# Altium schematic sheet Sheet1.SchDoc (part 2 of 3)
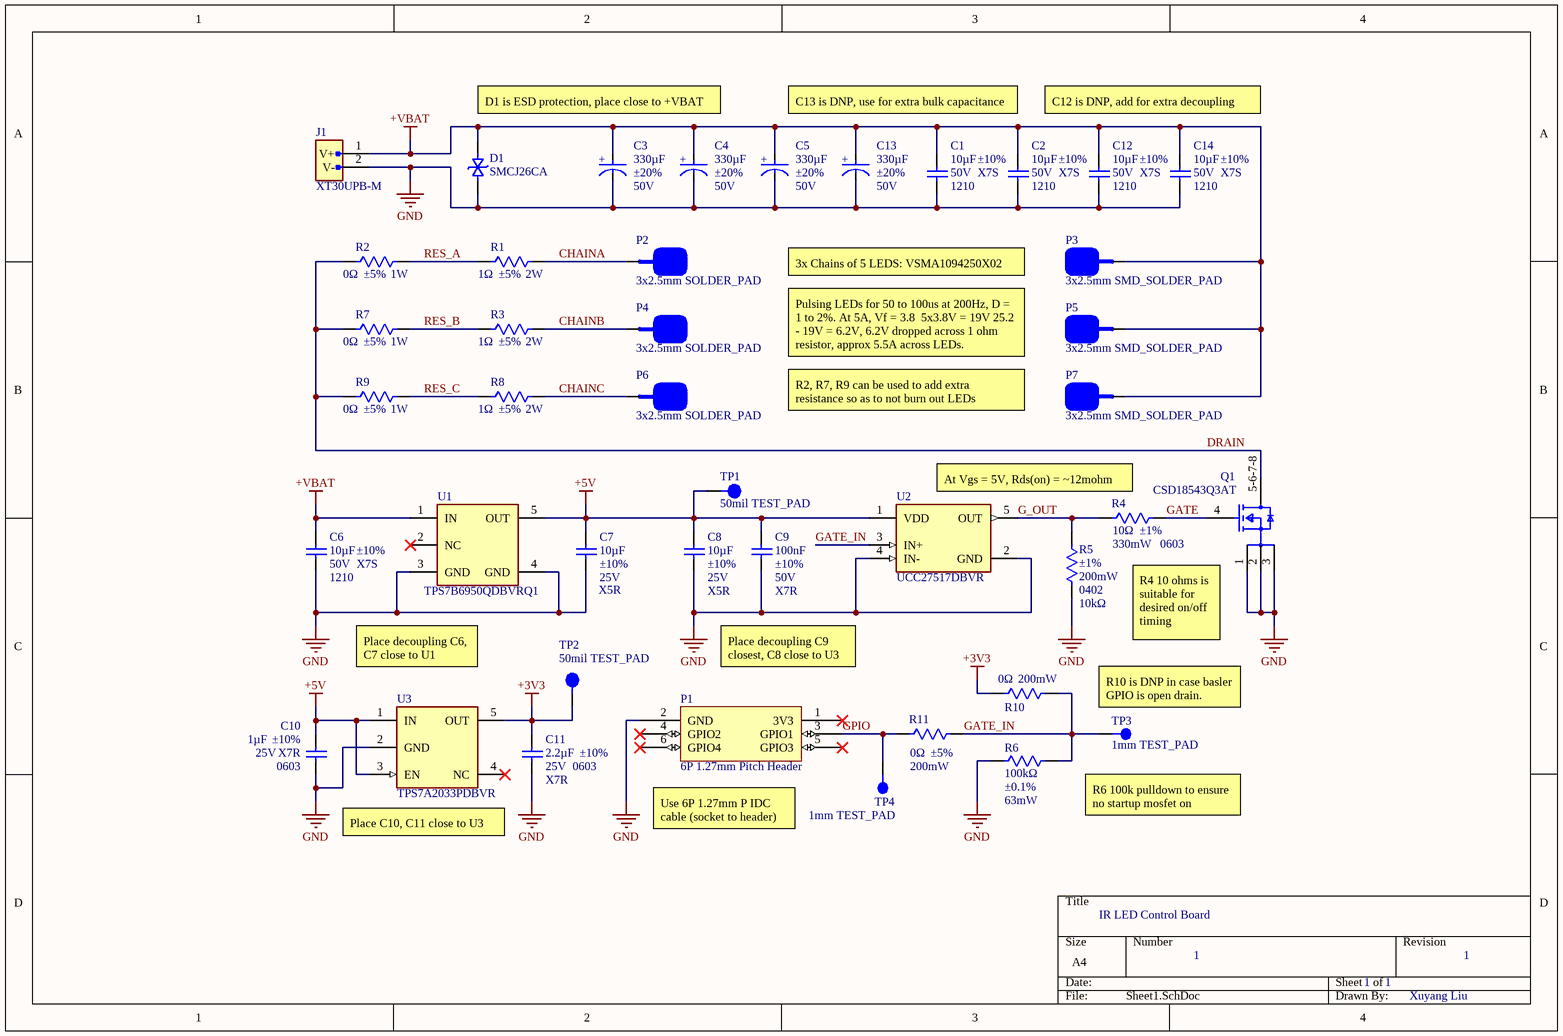
[diagram p1: Sheet1.SchDoc]
## Library data of the parts
C1 C2 C6 C12 C14 = GCM32EC71H106KA03L: 50V 10uF X7S ±10% 1210 Multilayer Ceramic Capacitors MLCC - SMD/SMT ROHS; Manufacturer: Murata; Manufacturer Lifecycle Status: IN PRODUCTION; Manufacturer Package Identifier: 1210 (3225 Metric); Supplier 1: DigiKey; Manufacturer Part Number: GCM32EC71H106KA03L; RoHS: Compliant; Category: Ceramic Capacitors; Stock 1: 65390; Pricing 1: 1=0.9, 10=0.569, 50=0.4396, 100=0.3997, 500=0.33218 (USD); Case Code (Imperial): 1210; Case Code (Metric): 3225; Country of Origin: Japan, Philippines; Depth: 2.5mm; Dielectric Material: Ceramic; Export Control Classification Number (ECCN) Code: EAR99; Height: 2.5mm; Harmonized Tariff Schedule (HTS) Code: 8532.24.00.20; Introduction Date: 2013-11-20; Length: 3.2mm; Lifecycle Status: Production; Material: Ceramic; Max Operating Temperature: 125°C; Min Operating Temperature: -55°C; Mount: Surface Mount; Number of Terminals: 2; Ratings: AEC-Q200; REACH SVHC: Yes; Schedule B: 8532240020, 8532240020|8532240020, 8532240020|8532240020|8532240020, 8532240020|8532240020|8532240020|8532240020; Termination: SMD/SMT; Voltage Rating (DC): 50V; Weight: 109.99615mg; Width: 2.5mm; ComponentLink1URL: https://datasheet.octopart.com:443/GCM32EC71H106KA03L-Murata-datasheet-96711494.pdf?src-supplier=element14+APAC; ComponentLink1Description: https://datasheet.octopart.com:443/GCM32EC71H106KA03L-Murata-datasheet-96711494.pdf?src-supplier=element14+APAC; ComponentLink2URL: https://datasheet.octopart.com:443/GCM32EC71H106KA03L-Murata-datasheet-141269272.pdf?src-supplier=Ciiva; ComponentLink2Description: https://datasheet.octopart.com:443/GCM32EC71H106KA03L-Murata-datasheet-141269272.pdf?src-supplier=Ciiva; ComponentLink3URL: https://datasheet.octopart.com:443/GCM32EC71H106KA03L-Murata-datasheet-140661459.pdf?src-supplier=Ciiva; ComponentLink3Description: https://datasheet.octopart.com:443/GCM32EC71H106KA03L-Murata-datasheet-140661459.pdf?src-supplier=Ciiva; ComponentLink4URL: https://datasheet.octopart.com:443/GCM32EC71H106KA03L-Murata-datasheet-138720471.pdf?src-supplier=Ciiva; ComponentLink4Description: https://datasheet.octopart.com:443/GCM32EC71H106KA03L-Murata-datasheet-138720471.pdf?src-supplier=Ciiva; ComponentLink5URL: https://datasheet.octopart.com:443/GCM32EC71H106KA03L-Murata-datasheet-12511495.pdf?src-supplier=TME; ComponentLink5Description: https://datasheet.octopart.com:443/GCM32EC71H106KA03L-Murata-datasheet-12511495.pdf?src-supplier=TME; ComponentLink6URL: http://sigma.octopart.com:80/reach_statement/Murata-company-16.pdf?src-supplier=Compliance+Statements; ComponentLink6Description: http://sigma.octopart.com:80/reach_statement/Murata-company-16.pdf?src-supplier=Compliance+Statements; Supplier Part Number 1: 490-14536-1-ND
C3-C5 C13 = 50ZLJ330M10X16: 330uF 50V ±20% Plugin, D10xL16mm Aluminum Electrolytic Capacitors - Leaded ROHS; Manufacturer: Rubycon; Leakage Current: 165µA; Ripple Current: 1.155A; Supplier 1: DigiKey; Manufacturer Part Number: 50ZLJ330M10X16; RoHS: Compliant; Category: Aluminum Electrolytic Capacitors; Stock 1: 990; Pricing 1: 1=0.92, 10=0.578, 50=0.4358, 100=0.3908, 500=0.31312, 1000=0.28861, 3000=0.25797, 5000=0.24651 (USD); Case/Package: Radial; Diameter: 10mm; Length: 16mm; Lifecycle Status: Production; Max Operating Temperature: 105°C; Min Operating Temperature: -40°C; Mount: Through Hole; Number of Terminals: 2; Packaging: Bulk; REACH SVHC: Yes; Terminal Pitch: 5mm; ComponentLink1URL: https://datasheet.octopart.com:443/50ZLJ330M10X16-Rubycon-datasheet-182101256.pdf?src-supplier=IHS; ComponentLink1Description: https://datasheet.octopart.com:443/50ZLJ330M10X16-Rubycon-datasheet-182101256.pdf?src-supplier=IHS; Supplier Part Number 1: 1189-50ZLJ330M10X16-ND
C7 C8 = GRM188R61E106KA73J: 25V 10uF X7R ±10% 0603 Multilayer Ceramic Capacitors MLCC - SMD/SMT ROHS; Manufacturer: Murata; Manufacturer Lifecycle Status: IN PRODUCTION; Supplier 1: DigiKey; Manufacturer Part Number: GRM188R61E106KA73J; RoHS: Compliant; Category: Ceramic Capacitors; Stock 1: 170211; Pricing 1: 1=0.26, 10=0.149, 50=0.1072, 100=0.0945, 500=0.07304, 1000=0.06643, 2500=0.05947, 5000=0.05528 (USD); Dielectric Material: Ceramic; Height: 800µm; Length: 1.6mm; Lifecycle Status: Production; Material: Ceramic; Max Operating Temperature: 85°C; Min Operating Temperature: -55°C; Mount: Surface Mount; Number of Terminals: 2; REACH SVHC: Yes; Thickness: 800µm; Voltage Rating (DC): 25V; Width: 800µm; ComponentLink1URL: https://datasheet.octopart.com:443/GRM188R61E106KA73J-Murata-datasheet-165579666.pdf?src-supplier=TME; ComponentLink1Description: https://datasheet.octopart.com:443/GRM188R61E106KA73J-Murata-datasheet-165579666.pdf?src-supplier=TME; ComponentLink2URL: https://datasheet.octopart.com:443/GRM188R61E106KA73J-Murata-datasheet-141274968.pdf?src-supplier=Ciiva; ComponentLink2Description: https://datasheet.octopart.com:443/GRM188R61E106KA73J-Murata-datasheet-141274968.pdf?src-supplier=Ciiva; ComponentLink3URL: https://datasheet.octopart.com:443/GRM188R61E106KA73J-Murata-datasheet-140704821.pdf?src-supplier=Ciiva; ComponentLink3Description: https://datasheet.octopart.com:443/GRM188R61E106KA73J-Murata-datasheet-140704821.pdf?src-supplier=Ciiva; ComponentLink4URL: https://datasheet.octopart.com:443/GRM188R61E106KA73J-Murata-datasheet-138742889.pdf?src-supplier=Ciiva; ComponentLink4Description: https://datasheet.octopart.com:443/GRM188R61E106KA73J-Murata-datasheet-138742889.pdf?src-supplier=Ciiva; ComponentLink5URL: https://datasheet.octopart.com/GRM188R61E106KA73J-Murata-datasheet-12515295.pdf; ComponentLink5Description: https://datasheet.octopart.com/GRM188R61E106KA73J-Murata-datasheet-12515295.pdf; ComponentLink6URL: https://datasheet.octopart.com/GRM188R61E106KA73J-Murata-datasheet-12510076.pdf; ComponentLink6Description: https://datasheet.octopart.com/GRM188R61E106KA73J-Murata-datasheet-12510076.pdf; ComponentLink7URL: https://datasheet.octopart.com/GRM188R61E106KA73J-Murata-datasheet-11978611.pdf; ComponentLink7Description: https://datasheet.octopart.com/GRM188R61E106KA73J-Murata-datasheet-11978611.pdf; ComponentLink8URL: https://datasheet.octopart.com/GRM188R61E106KA73J-Murata-datasheet-10025737.pdf; ComponentLink8Description: https://datasheet.octopart.com/GRM188R61E106KA73J-Murata-datasheet-10025737.pdf; ComponentLink9URL: https://datasheet.octopart.com/GRM188R61E106KA73J-Murata-datasheet-8819587.pdf; ComponentLink9Description: https://datasheet.octopart.com/GRM188R61E106KA73J-Murata-datasheet-8819587.pdf; ComponentLink10URL: http://sigma.octopart.com:80/reach_statement/Murata-company-16.pdf?src-supplier=Compliance+Statements; ComponentLink10Description: http://sigma.octopart.com:80/reach_statement/Murata-company-16.pdf?src-supplier=Compliance+Statements; Supplier Part Number 1: 490-GRM188R61E106KA73JCT-ND; Case/Package: 0603
C9 = GCJ188R71H104KA12D: 50V 100nF X7R ±10% 0603 Multilayer Ceramic Capacitors MLCC - SMD/SMT ROHS; Manufacturer: Murata; Manufacturer Lifecycle Status: IN PRODUCTION; Manufacturer Part Number: GCJ188R71H104KA12D; RoHS: Compliant; Category: Ceramic Capacitors; Stock 1: 938408; Pricing 1: 1=0.13, 10=0.073, 50=0.0508, 100=0.044, 500=0.0327, 1000=0.02922 (USD); Case Code (Imperial): 0603; Case Code (Metric): 1608; Country of Origin: Japan, Philippines; Depth: 800µm; Dielectric Material: Ceramic; Export Control Classification Number (ECCN) Code: EAR99; Features: Soft Termination; Height: 800µm; Harmonized Tariff Schedule (HTS) Code: 8532.24.00.20; Introduction Date: 2012-05-07; Lead Free: Lead Free; Length: 1.6mm; Lifecycle Status: Production; Material: Ceramic; Max Operating Temperature: 125°C; Min Operating Temperature: -55°C; Mount: Surface Mount; Number of Terminals: 2; Packaging: Cut Tape; Radiation Hardening: No; Ratings: AEC-Q200; REACH SVHC: Yes; Schedule B: 8532240020, 8532240020|8532240020, 8532240020|8532240020|8532240020, 8532240020|8532240020|8532240020|8532240020; Termination: SMD/SMT; Voltage Rating (DC): 50V; Width: 800µm; ComponentLink1URL: https://datasheet.octopart.com:443/GCJ188R71H104KA12D-Murata-datasheet-68586835.pdf?src-supplier=Newark; ComponentLink1Description: https://datasheet.octopart.com:443/GCJ188R71H104KA12D-Murata-datasheet-68586835.pdf?src-supplier=Newark; ComponentLink2URL: https://datasheet.octopart.com:443/GCJ188R71H104KA12D-Murata-datasheet-140654765.pdf?src-supplier=Ciiva; ComponentLink2Description: https://datasheet.octopart.com:443/GCJ188R71H104KA12D-Murata-datasheet-140654765.pdf?src-supplier=Ciiva; ComponentLink3URL: https://datasheet.octopart.com:443/GCJ188R71H104KA12D-Murata-datasheet-138714437.pdf?src-supplier=Ciiva; ComponentLink3Description: https://datasheet.octopart.com:443/GCJ188R71H104KA12D-Murata-datasheet-138714437.pdf?src-supplier=Ciiva; ComponentLink4URL: https://datasheet.octopart.com:443/GCJ188R71H104KA12D-Murata-datasheet-165611796.pdf?src-supplier=TME; ComponentLink4Description: https://datasheet.octopart.com:443/GCJ188R71H104KA12D-Murata-datasheet-165611796.pdf?src-supplier=TME; ComponentLink5URL: https://datasheet.octopart.com:443/GCJ188R71H104KA12D-Murata-datasheet-12524712.pdf?src-supplier=Future+Electronics; ComponentLink5Description: https://datasheet.octopart.com:443/GCJ188R71H104KA12D-Murata-datasheet-12524712.pdf?src-supplier=Future+Electronics; ComponentLink6URL: https://datasheet.octopart.com/GCJ188R71H104KA12D-Murata-datasheet-14405607.pdf; ComponentLink6Description: https://datasheet.octopart.com/GCJ188R71H104KA12D-Murata-datasheet-14405607.pdf; ComponentLink7URL: http://sigma.octopart.com:80/reach_statement/Murata-company-16.pdf?src-supplier=Compliance+Statements; ComponentLink7Description: http://sigma.octopart.com:80/reach_statement/Murata-company-16.pdf?src-supplier=Compliance+Statements; Supplier 1: DigiKey; Supplier Part Number 1: 490-5798-1-ND; Case/Package: 0603; Capacitance: 100nF
C10 = GCM188R71E105KA64D: 25V 1uF X7R ±10% 0603 Multilayer Ceramic Capacitors MLCC - SMD/SMT ROHS; Manufacturer: Murata; Manufacturer Lifecycle Status: IN PRODUCTION; Supplier 1: DigiKey; Manufacturer Part Number: GCM188R71E105KA64D; RoHS: Compliant; Category: Ceramic Capacitors; Stock 1: 751115; Pricing 1: 1=0.19, 10=0.106, 50=0.0752, 100=0.0658, 500=0.04994, 1000=0.04504 (USD); Case Code (Imperial): 0603; Case Code (Metric): 1608; Country of Origin: Philippines; Depth: 800µm; Dielectric Material: Ceramic; Export Control Classification Number (ECCN) Code: EAR99; Height: 800µm; Harmonized Tariff Schedule (HTS) Code: 8532.24.00.20; Introduction Date: 2010-10-29; Lead Free: Lead Free; Length: 1.6mm; Lifecycle Status: Production; Material: Ceramic; Max Operating Temperature: 125°C; Min Operating Temperature: -55°C; Mount: Surface Mount; Number of Terminals: 2; Packaging: Cut Tape; Radiation Hardening: No; Ratings: AEC-Q200; REACH SVHC: Yes; Schedule B: 8532240020, 8532240020|8532240020, 8532240020|8532240020|8532240020, 8532240020|8532240020|8532240020|8532240020; Termination: SMD/SMT; Voltage Rating: 25V; Voltage Rating (DC): 25V; Weight: 6.293594mg; Width: 800µm; ComponentLink1URL: https://datasheet.octopart.com:443/GCM188R71E105KA64D-Murata-datasheet-39128443.pdf?src-supplier=Newark; ComponentLink1Description: https://datasheet.octopart.com:443/GCM188R71E105KA64D-Murata-datasheet-39128443.pdf?src-supplier=Newark; ComponentLink2URL: https://datasheet.octopart.com:443/GCM188R71E105KA64D-Murata-datasheet-62316951.pdf?src-supplier=element14+APAC; ComponentLink2Description: https://datasheet.octopart.com:443/GCM188R71E105KA64D-Murata-datasheet-62316951.pdf?src-supplier=element14+APAC; ComponentLink3URL: https://datasheet.octopart.com:443/GCM188R71E105KA64D-Murata-datasheet-141267554.pdf?src-supplier=Geoflip; ComponentLink3Description: https://datasheet.octopart.com:443/GCM188R71E105KA64D-Murata-datasheet-141267554.pdf?src-supplier=Geoflip; ComponentLink4URL: https://datasheet.octopart.com:443/GCM188R71E105KA64D-Murata-datasheet-140658666.pdf?src-supplier=Ciiva; ComponentLink4Description: https://datasheet.octopart.com:443/GCM188R71E105KA64D-Murata-datasheet-140658666.pdf?src-supplier=Ciiva; ComponentLink5URL: https://datasheet.octopart.com:443/GCM188R71E105KA64D-Murata-datasheet-138718232.pdf?src-supplier=Ciiva; ComponentLink5Description: https://datasheet.octopart.com:443/GCM188R71E105KA64D-Murata-datasheet-138718232.pdf?src-supplier=Ciiva; ComponentLink6URL: https://datasheet.octopart.com:443/GCM188R71E105KA64D-Murata-datasheet-81455541.pdf?src-supplier=TME; ComponentLink6Description: https://datasheet.octopart.com:443/GCM188R71E105KA64D-Murata-datasheet-81455541.pdf?src-supplier=TME; ComponentLink7URL: https://datasheet.octopart.com/GCM188R71E105KA64D-Murata-datasheet-14404430.pdf; ComponentLink7Description: https://datasheet.octopart.com/GCM188R71E105KA64D-Murata-datasheet-14404430.pdf; ComponentLink8URL: https://datasheet.octopart.com:443/GCM188R71E105KA64D-Murata-datasheet-14393380.pdf?src-supplier=Future+Electronics; ComponentLink8Description: https://datasheet.octopart.com:443/GCM188R71E105KA64D-Murata-datasheet-14393380.pdf?src-supplier=Future+Electronics; ComponentLink9URL: https://datasheet.octopart.com:443/GCM188R71E105KA64D-Murata-datasheet-44103482.pdf?src-supplier=Future+Electronics; ComponentLink9Description: https://datasheet.octopart.com:443/GCM188R71E105KA64D-Murata-datasheet-44103482.pdf?src-supplier=Future+Electronics; ComponentLink10URL: http://sigma.octopart.com:80/reach_statement/Murata-company-16.pdf?src-supplier=Compliance+Statements; ComponentLink10Description: http://sigma.octopart.com:80/reach_statement/Murata-company-16.pdf?src-supplier=Compliance+Statements; Supplier Part Number 1: 490-10673-1-ND
C11 = GRM188Z71E225KE43D: 25V 2.2uF X7R ±10% 0603 Multilayer Ceramic Capacitors MLCC - SMD/SMT ROHS; Manufacturer: Murata; Manufacturer Lifecycle Status: IN PRODUCTION; Supplier 1: DigiKey; Manufacturer Part Number: GRM188Z71E225KE43D; RoHS: Compliant; Category: Ceramic Capacitors; Stock 1: 149124; Pricing 1: 1=0.17, 10=0.096, 50=0.068, 100=0.0593, 500=0.04474, 1000=0.04026 (USD); Export Control Classification Number (ECCN) Code: EAR99; Height: 800µm; Harmonized Tariff Schedule (HTS) Code: 8532.24.00.20; Introduction Date: 2017-02-21; Length: 1.6mm; Lifecycle Status: Production; Material: Ceramic; Max Operating Temperature: 125°C; Min Operating Temperature: -55°C; Mount: Surface Mount; Number of Terminals: 2; REACH SVHC: Yes; Thickness: 800µm; Voltage Rating (DC): 25V; Width: 800µm; ComponentLink1URL: https://datasheet.octopart.com:443/GRM188Z71E225KE43D-Murata-datasheet-141276026.pdf?src-supplier=Geoflip; ComponentLink1Description: https://datasheet.octopart.com:443/GRM188Z71E225KE43D-Murata-datasheet-141276026.pdf?src-supplier=Geoflip; ComponentLink2URL: https://datasheet.octopart.com:443/GRM188Z71E225KE43D-Murata-datasheet-165579666.pdf?src-supplier=TME; ComponentLink2Description: https://datasheet.octopart.com:443/GRM188Z71E225KE43D-Murata-datasheet-165579666.pdf?src-supplier=TME; ComponentLink3URL: https://datasheet.octopart.com:443/GRM188Z71E225KE43D-Murata-datasheet-140705919.pdf?src-supplier=Ciiva; ComponentLink3Description: https://datasheet.octopart.com:443/GRM188Z71E225KE43D-Murata-datasheet-140705919.pdf?src-supplier=Ciiva; ComponentLink4URL: https://datasheet.octopart.com:443/GRM188Z71E225KE43D-Murata-datasheet-138743437.pdf?src-supplier=Ciiva; ComponentLink4Description: https://datasheet.octopart.com:443/GRM188Z71E225KE43D-Murata-datasheet-138743437.pdf?src-supplier=Ciiva; ComponentLink5URL: http://sigma.octopart.com:80/reach_statement/Murata-company-16.pdf?src-supplier=Compliance+Statements; ComponentLink5Description: http://sigma.octopart.com:80/reach_statement/Murata-company-16.pdf?src-supplier=Compliance+Statements; Supplier Part Number 1: 490-GRM188Z71E225KE43DCT-ND; Capacitance: 2.2µF
D1 = SMCJ26CA: SMCJ Series 42.1 V 1.5 kW Surface Mount Bi-Directional TVS Diode - DO-214AB; Manufacturer: Littelfuse; Breakdown Voltage: 30.4V; Clamping Voltage: 42.1V; Direction: Bidirectional; Leakage Current: 1µA; Max Breakdown Voltage: 31.9V; Max Power Dissipation: 6.5W; Max Surge Current: 35.7A; Min Breakdown Voltage: 28.9V; Number of Bidirectional Channels: 1; Operating Supply Voltage: 26V; Peak Pulse Power: 1.5kW; Power Line Protection: No; Test Current: 1mA; Supplier 1: DigiKey; Manufacturer Part Number: SMCJ26CA; RoHS: Compliant; Category: TVS Diodes; Stock 1: 33241; Pricing 1: 1=0.97, 10=0.603, 100=0.3916, 500=0.30046, 1000=0.27108 (USD); China RoHS: Non-Compliant; Composition: Zener; Country of Origin: Mainland China, Philippines; Export Control Classification Number (ECCN) Code: EAR99; Height: 2.62mm; Harmonized Tariff Schedule (HTS) Code: 8541.10.00.50; Introduction Date: 2003-11-20; Lead Free: Lead Free; Length: 8.13mm; Lifecycle Status: Production; Max Operating Temperature: 150°C; Max Reverse Leakage Current: 1µA; Min Operating Temperature: -65°C; Mount: Surface Mount; Number of Channels: 1; Number of Elements: 1; Number of Pins: 2; Number of Terminals: 2; Packaging: Cut Tape; Peak Pulse Current: 35.7A; Peak Reverse Current: 1µA; Polarity: Bidirectional; Power Dissipation: 1.5kW; Power Rating: 1.5kW; Radiation Hardening: No; REACH SVHC: No; Reverse Breakdown Voltage: 28.9V; Reverse Standoff Voltage: 26V; Reverse Voltage: 26V; Schedule B: 8541100080, 8541100080|8541100080|8541100080|8541100080|8541100080; Termination: SMD/SMT; Voltage Rating (DC): 26V; Width: 6.22mm; ComponentLink1URL: https://datasheet.octopart.com:443/SMCJ26CA-Littelfuse-datasheet-150463582.pdf?src-supplier=Newark; ComponentLink1Description: https://datasheet.octopart.com:443/SMCJ26CA-Littelfuse-datasheet-150463582.pdf?src-supplier=Newark; ComponentLink2URL: https://datasheet.octopart.com:443/SMCJ26CA-Littelfuse-datasheet-65933527.pdf?src-supplier=element14+APAC; ComponentLink2Description: https://datasheet.octopart.com:443/SMCJ26CA-Littelfuse-datasheet-65933527.pdf?src-supplier=element14+APAC; ComponentLink3URL: https://datasheet.octopart.com:443/SMCJ26CA-Littelfuse-datasheet-10669596.pdf?src-supplier=Farnell; ComponentLink3Description: https://datasheet.octopart.com:443/SMCJ26CA-Littelfuse-datasheet-10669596.pdf?src-supplier=Farnell; ComponentLink4URL: https://datasheet.octopart.com:443/SMCJ26CA-Littelfuse-datasheet-8450502.pdf?src-supplier=Farnell; ComponentLink4Description: https://datasheet.octopart.com:443/SMCJ26CA-Littelfuse-datasheet-8450502.pdf?src-supplier=Farnell; ComponentLink5URL: https://datasheet.octopart.com:443/SMCJ26CA-Littelfuse-datasheet-5314397.pdf?src-supplier=Farnell; ComponentLink5Description: https://datasheet.octopart.com:443/SMCJ26CA-Littelfuse-datasheet-5314397.pdf?src-supplier=Farnell; ComponentLink6URL: https://datasheet.octopart.com:443/SMCJ26CA-Littelfuse-datasheet-530249.pdf?src-supplier=Farnell; ComponentLink6Description: https://datasheet.octopart.com:443/SMCJ26CA-Littelfuse-datasheet-530249.pdf?src-supplier=Farnell; ComponentLink7URL: https://datasheet.octopart.com:443/SMCJ26CA-Littelfuse-datasheet-24577164.pdf?src-supplier=Fuses+Unlimited; ComponentLink7Description: https://datasheet.octopart.com:443/SMCJ26CA-Littelfuse-datasheet-24577164.pdf?src-supplier=Fuses+Unlimited; ComponentLink8URL: https://datasheet.octopart.com:443/SMCJ26CA-Littelfuse-datasheet-1147.pdf?src-supplier=DigiKey; ComponentLink8Description: https://datasheet.octopart.com:443/SMCJ26CA-Littelfuse-datasheet-1147.pdf?src-supplier=DigiKey; Supplier Part Number 1: SMCJ26CALFCT-ND
J1 = XT30UPB-M: Socket; DC supply; XT30; male; PIN: 2; on PCBs; THT; Colour: yellow; MF: AMASS; SnapEDA_Link: https://www.snapeda.com/parts/XT30PW-M/AMASS/view-part/?ref=snap; Package: None; Value: *; MP: XT30UPB-M; Check_prices: https://www.snapeda.com/parts/XT30PW-M/AMASS/view-part/?ref=eda
P1 = 20021121-00006C4LF: Pin Header, Vertical, Board-to-Board, 1.27 mm, 2 Rows, 6 Contacts, Surface Mount Straight; Manufacturer: Amphenol Communications Solutions; Connector Type: Header, Male Pin; Contact Resistance: 30mΩ; Current Rating: 1A; Dielectric Material: Polyethylene; Gender: Male; Insulation Resistance: 100MΩ; Mating Post Length: 3.05mm; Max Voltage Rating (AC): 125V; Number of Contacts: 6; Operating Force: 2.1406N; Plating Thickness: 254nm; Row Spacing: 3.9116mm; Stack Height: 3mm; Supplier 1: DigiKey; Manufacturer Part Number: 20021121-00006C4LF; RoHS: Compliant; Category: Headers and Wire Housings; Stock 1: 95236; Pricing 1: 1=0.64, 10=0.544, 100=0.4618 (USD); China RoHS: Compliant; Color: Black; Contact Material: Gold; Contact Mating Length: 3.048mm; Contact Plating: Gold; Depth: 3.4mm; Export Control Classification Number (ECCN) Code: EAR99; Height: 5.05mm; Housing Color: Black; Housing Material: Thermoplastic; Harmonized Tariff Schedule (HTS) Code: 8536.69.40.40; Insulation Color: Black; Introduction Date: 2010-01-29; Length: 3.81mm; Lifecycle Status: Production; Max Operating Temperature: 105°C; Min Operating Temperature: -40°C; Mount: Surface Mount; Number of Pins: 6; Number of Positions: 6; Number of Rows: 2; Orientation: Straight; Pitch: 1.27mm; Radiation Hardening: No; REACH SVHC: Yes; Terminal Pitch: 1.27mm; Termination: Solder; Voltage Rating: 125V; ComponentLink1URL: https://datasheet.octopart.com:443/20021121-00006C4LF-Amphenol-Communications-Solutions-datasheet-102830508.pdf?src-supplier=Electro+Sonic; ComponentLink1Description: https://datasheet.octopart.com:443/20021121-00006C4LF-Amphenol-Communications-Solutions-datasheet-102830508.pdf?src-supplier=Electro+Sonic; ComponentLink2URL: https://datasheet.octopart.com:443/20021121-00006C4LF-Amphenol-Communications-Solutions-datasheet-21379658.pdf?src-supplier=Farnell; ComponentLink2Description: https://datasheet.octopart.com:443/20021121-00006C4LF-Amphenol-Communications-Solutions-datasheet-21379658.pdf?src-supplier=Farnell; ComponentLink3URL: https://datasheet.octopart.com:443/20021121-00006C4LF-Amphenol-Communications-Solutions-datasheet-62305862.pdf?src-supplier=Farnell; ComponentLink3Description: https://datasheet.octopart.com:443/20021121-00006C4LF-Amphenol-Communications-Solutions-datasheet-62305862.pdf?src-supplier=Farnell; ComponentLink4URL: https://datasheet.octopart.com:443/20021121-00006C4LF-FCI-datasheet-17852665.pdf?src-supplier=Farnell; ComponentLink4Description: https://datasheet.octopart.com:443/20021121-00006C4LF-FCI-datasheet-17852665.pdf?src-supplier=Farnell; ComponentLink5URL: https://datasheet.octopart.com:443/20021121-00006C4LF-Amphenol-Communications-Solutions-datasheet-98396828.pdf?src-supplier=element14+APAC; ComponentLink5Description: https://datasheet.octopart.com:443/20021121-00006C4LF-Amphenol-Communications-Solutions-datasheet-98396828.pdf?src-supplier=element14+APAC; ComponentLink6URL: https://datasheet.octopart.com:443/20021121-00006C4LF-FCI-datasheet-8699946.pdf?src-supplier=element14+APAC; ComponentLink6Description: https://datasheet.octopart.com:443/20021121-00006C4LF-FCI-datasheet-8699946.pdf?src-supplier=element14+APAC; ComponentLink7URL: https://datasheet.octopart.com:443/20021121-00006C4LF-FCI-datasheet-8640585.pdf?src-supplier=element14+APAC; ComponentLink7Description: https://datasheet.octopart.com:443/20021121-00006C4LF-FCI-datasheet-8640585.pdf?src-supplier=element14+APAC; ComponentLink8URL: https://datasheet.octopart.com:443/20021121-00006C4LF-FCI-datasheet-13726100.pdf?src-supplier=_legacy+Avnet; ComponentLink8Description: https://datasheet.octopart.com:443/20021121-00006C4LF-FCI-datasheet-13726100.pdf?src-supplier=_legacy+Avnet; ComponentLink9URL: https://datasheet.octopart.com:443/20021121-00006C4LF-FCI-datasheet-11547764.pdf?src-supplier=Arrow+Electronics; ComponentLink9Description: https://datasheet.octopart.com:443/20021121-00006C4LF-FCI-datasheet-11547764.pdf?src-supplier=Arrow+Electronics; Supplier Part Number 1: 609-3693-1-ND
P2-P7 = 3x2.5mm SMD_SOLDER_PAD: Plated SMD 3x2.5mm SOLDER_PAD
Q1 = CSD18543Q3AT: 60-V, N channel NexFET™ power MOSFET, single SON 3 mm x 3 mm, 9.9 mOhm 8-VSONP -55 to 150; Manufacturer: Texas Instruments; Manufacturer Lifecycle Status: ACTIVE; Continuous Drain Current (ID): 12A; Drain to Source Breakdown Voltage: 60V; Drain to Source Resistance: 8.1mΩ; Gate to Source Voltage (Vgs): 20V; Max Junction Temperature (Tj): 150°C; Number of Channels: 1; Power Dissipation: 2.8W; Turn-Off Delay Time: 8ns; Turn-On Delay Time: 9ns; Supplier 1: DigiKey; Manufacturer Part Number: CSD18543Q3AT; RoHS: Compliant; Category: MOSFETs; Stock 1: 4526; Pricing 1: 1=2.29, 10=1.462, 100=0.9912 (USD); Drain to Source Voltage (Vdss): 60V; Element Configuration: Single; Height: 900µm; Length: 3.3mm; Lifecycle Status: Production; Max Operating Temperature: 150°C; Min Operating Temperature: -55°C; Number of Pins: 8; Schedule B: 8541290080, 8541290080|8541290080, 8541290080|8541290080|8541290080|8541290080|8541290080; Thickness: 800µm; Width: 3.3mm; ComponentLink1URL: https://sigma.octopart.com:443/184372195/technical_drawing/Texas-Instruments-CSD18543Q3AT.pdf?src-supplier=Texas+Instruments; ComponentLink1Description: https://sigma.octopart.com:443/184372195/technical_drawing/Texas-Instruments-CSD18543Q3AT.pdf?src-supplier=Texas+Instruments; ComponentLink2URL: https://octopart.com:443/opatz8j6/c1?t=SsZgKvRmmw05RbnxMb6edfQyltnbhyNkxL9f19K7YcDX2j1foEMjoZPIc1l6vPtWCior1K7MK4Ecl1cKgo7MV1fVyam4EaqiB1Wt0OcocW5rsSx2yHOKWqXc7qV_A0CR85SjtUmhgxtnEX_hM021VMdHmrWiCD7BUQ-eFjN1wT7d3uOjDZQ6HjTgQKaKXek5tndBDP7-u4o-8p4DuqFUS4zP_5tfnTJWQnkrrbk4pzubypwZn_kVBqW1ULvAfegc6D8FFE5u7LfzGe8qoWlBn9GcTR49XIZj8i8BnCmCBkJ1P3eljVqSMcggCW9mefLwr27y7eoW1Wo15o2SxNy6lW0bRjf9UomrOlGTID-rE5uK6cy_FeSS_Sykc-I3kUdFVxsB4BxBI3g&src-supplier=Texas+Instruments; ComponentLink2Description: https://octopart.com:443/opatz8j6/c1?t=SsZgKvRmmw05RbnxMb6edfQyltnbhyNkxL9f19K7YcDX2j1foEMjoZPIc1l6vPtWCior1K7MK4Ecl1cKgo7MV1fVyam4EaqiB1Wt0OcocW5rsSx2yHOKWqXc7qV_A0CR85SjtUmhgxtnEX_hM021VMdHmrWiCD7BUQ-eFjN1wT7d3uOjDZQ6HjTgQKaKXek5tndBDP7-u4o-8p4DuqFUS4zP_5tfnTJWQnkrrbk4pzubypwZn_kVBqW1ULvAfegc6D8FFE5u7LfzGe8qoWlBn9GcTR49XIZj8i8BnCmCBkJ1P3eljVqSMcggCW9mefLwr27y7eoW1Wo15o2SxNy6lW0bRjf9UomrOlGTID-rE5uK6cy_FeSS_Sykc-I3kUdFVxsB4BxBI3g&src-supplier=Texas+Instruments; ComponentLink3URL: https://sigma.octopart.com:443/181443430/technical_drawing/Texas-Instruments-CSD18543Q3AT.pdf?src-supplier=Texas+Instruments; ComponentLink3Description: https://sigma.octopart.com:443/181443430/technical_drawing/Texas-Instruments-CSD18543Q3AT.pdf?src-supplier=Texas+Instruments; ComponentLink4URL: https://datasheet.octopart.com:443/CSD18543Q3AT-Texas-Instruments-datasheet-73765672.pdf?src-supplier=Upverter; ComponentLink4Description: https://datasheet.octopart.com:443/CSD18543Q3AT-Texas-Instruments-datasheet-73765672.pdf?src-supplier=Upverter; ComponentLink5URL: https://datasheet.octopart.com:443/CSD18543Q3AT-Texas-Instruments-datasheet-160724818.pdf?src-supplier=Augswan; ComponentLink5Description: https://datasheet.octopart.com:443/CSD18543Q3AT-Texas-Instruments-datasheet-160724818.pdf?src-supplier=Augswan; ComponentLink6URL: http://sigma.octopart.com:80/reach_statement/Texas-Instruments-company-64.pdf?src-supplier=Compliance+Statements; ComponentLink6Description: http://sigma.octopart.com:80/reach_statement/Texas-Instruments-company-64.pdf?src-supplier=Compliance+Statements; ComponentLink7URL: http://sigma.octopart.com:80/conflict_mineral_statement/Texas-Instruments-company-63.pdf?src-supplier=Compliance+Statements; ComponentLink7Description: http://sigma.octopart.com:80/conflict_mineral_statement/Texas-Instruments-company-63.pdf?src-supplier=Compliance+Statements; Supplier Part Number 1: 296-45302-1-ND
R1 R3 R8 = CRM2512-JW-1R0ELF: 2W Thick Film Resistors ±200ppm/℃ ±5% 1Ω 2512 Chip Resistor - Surface Mount ROHS; Manufacturer: Bourns; Temperature Coefficient: 200ppm/°C; Voltage Rating: 600V; Working Voltage: 300V; Manufacturer Part Number: CRM2512-JW-1R0ELF; RoHS: Compliant; Category: Chip SMD Resistors; Stock 1: 57195; Pricing 1: 1=0.45, 10=0.287, 25=0.2428, 50=0.2156, 100=0.1922, 250=0.1666, 500=0.1506, 1000=0.13697 (USD); Case Code (Imperial): 2512; Case Code (Metric): 6432; China RoHS: Non-Compliant; Composition: Thick Film; Contact Plating: Tin; Country of Origin: Taiwan; Depth: 3.1mm; Export Control Classification Number (ECCN) Code: EAR99; Height: 600µm; Harmonized Tariff Schedule (HTS) Code: 8533.21.00.30; Introduction Date: 2011-02-17; Length: 6.3mm; Lifecycle Status: Production; Max Operating Temperature: 155°C; Max Power Dissipation: 2W; Military Standard: Not; Min Operating Temperature: -55°C; Mount: Surface Mount; Number of Pins: 2; Number of Terminals: 2; Number of Terminations: 2; Packaging: Cut Tape; REACH SVHC: Yes; Schedule B: 8533210045, 8533210045|8533210045, 8533210045|8533210045|8533210045, 8533210045|8533210045|8533210045|8533210045; Termination: SMD/SMT; Voltage Rating (DC): 600V; Width: 3.1mm; ComponentLink1URL: https://datasheet.octopart.com:443/CRM2512-JW-1R0ELF-Bourns-datasheet-170520297.pdf?src-supplier=IHS; ComponentLink1Description: https://datasheet.octopart.com:443/CRM2512-JW-1R0ELF-Bourns-datasheet-170520297.pdf?src-supplier=IHS; ComponentLink2URL: https://datasheet.octopart.com:443/CRM2512-JW-1R0ELF-Bourns-datasheet-47549200.pdf?src-supplier=Burklin+Elektronik; ComponentLink2Description: https://datasheet.octopart.com:443/CRM2512-JW-1R0ELF-Bourns-datasheet-47549200.pdf?src-supplier=Burklin+Elektronik; ComponentLink3URL: https://datasheet.octopart.com:443/CRM2512-JW-1R0ELF-Bourns-datasheet-164353756.pdf?src-supplier=JRH+Electronics; ComponentLink3Description: https://datasheet.octopart.com:443/CRM2512-JW-1R0ELF-Bourns-datasheet-164353756.pdf?src-supplier=JRH+Electronics; ComponentLink4URL: https://datasheet.octopart.com:443/CRM2512-JW-1R0ELF-Bourns-datasheet-156155912.pdf?src-supplier=Newark; ComponentLink4Description: https://datasheet.octopart.com:443/CRM2512-JW-1R0ELF-Bourns-datasheet-156155912.pdf?src-supplier=Newark; ComponentLink5URL: https://datasheet.octopart.com:443/CRM2512-JW-1R0ELF-Bourns-datasheet-10028171.pdf?src-supplier=Newark; ComponentLink5Description: https://datasheet.octopart.com:443/CRM2512-JW-1R0ELF-Bourns-datasheet-10028171.pdf?src-supplier=Newark; ComponentLink6URL: https://datasheet.octopart.com:443/CRM2512-JW-1R0ELF-Bourns-datasheet-14874567.pdf?src-supplier=RS+(Formerly+Allied+Electronics); ComponentLink6Description: https://datasheet.octopart.com:443/CRM2512-JW-1R0ELF-Bourns-datasheet-14874567.pdf?src-supplier=RS+(Formerly+Allied+Electronics); ComponentLink7URL: https://datasheet.octopart.com:443/CRM2512-JW-1R0ELF-Bourns-datasheet-154729672.pdf?src-supplier=Electro+Sonic; ComponentLink7Description: https://datasheet.octopart.com:443/CRM2512-JW-1R0ELF-Bourns-datasheet-154729672.pdf?src-supplier=Electro+Sonic; ComponentLink8URL: https://datasheet.octopart.com:443/CRM2512-JW-1R0ELF-Bourns-datasheet-182141858.pdf?src-supplier=Master+Electronics; ComponentLink8Description: https://datasheet.octopart.com:443/CRM2512-JW-1R0ELF-Bourns-datasheet-182141858.pdf?src-supplier=Master+Electronics; ComponentLink9URL: https://datasheet.octopart.com:443/CRM2512-JW-1R0ELF-Bourns-datasheet-10186184.pdf?src-supplier=element14; ComponentLink9Description: https://datasheet.octopart.com:443/CRM2512-JW-1R0ELF-Bourns-datasheet-10186184.pdf?src-supplier=element14; ComponentLink10URL: https://datasheet.octopart.com:443/CRM2512-JW-1R0ELF-Bourns-datasheet-8556829.pdf?src-supplier=element14; ComponentLink10Description: https://datasheet.octopart.com:443/CRM2512-JW-1R0ELF-Bourns-datasheet-8556829.pdf?src-supplier=element14; ComponentLink11URL: http://sigma.octopart.com:80/conflict_mineral_statement/Bourns-company-36.pdf?src-supplier=Compliance+Statements; ComponentLink11Description: http://sigma.octopart.com:80/conflict_mineral_statement/Bourns-company-36.pdf?src-supplier=Compliance+Statements; Supplier Part Number 1: CRM2512-JW-1R0ELFCT-ND; Supplier 1: DigiKey; Case/Package: 2512; Resistance: 1Ω
R2 R7 R9 = CR2512-J/-000ELF: 0Ω RES SMD 0 OHM JUMPER 1W 2512 / 0 Ohms Jumper 1W Chip Resistor 2512 (6432 Metric) Thick Film; Manufacturer: Bourns; Temperature Coefficient: 500ppm/°C; Voltage Rating: 200V; Supplier 1: DigiKey; Manufacturer Part Number: CR2512-J/-000ELF; RoHS: Compliant; Category: Chip SMD Resistors; Stock 1: 67164; Pricing 1: 1=0.11, 10=0.071, 25=0.0592, 50=0.052, 100=0.0458, 250=0.03904, 500=0.03482, 1000=0.03123 (USD); Case/Package: 2512; Case Code (Imperial): 2512; Case Code (Metric): 6332; China RoHS: Non-Compliant; Composition: Thick Film; Contact Plating: Tin; Depth: 3.1mm; Height: 600µm; Length: 6.3mm; Lifecycle Status: Production; Max Operating Temperature: 155°C; Max Power Dissipation: 1W; Military Standard: Not; Min Operating Temperature: -55°C; Mount: Surface Mount; Number of Terminals: 2; Radiation Hardening: No; REACH SVHC: Yes; Termination: SMD/SMT; Voltage Rating (DC): 200V; Width: 3.2mm; ComponentLink1URL: https://datasheet.octopart.com:443/CR2512-J--000ELF-Bourns-datasheet-159578630.pdf?src-supplier=IHS; ComponentLink1Description: https://datasheet.octopart.com:443/CR2512-J--000ELF-Bourns-datasheet-159578630.pdf?src-supplier=IHS; ComponentLink2URL: https://datasheet.octopart.com:443/CR2512-J--000ELF-Bourns-datasheet-159777434.pdf?src-supplier=IHS; ComponentLink2Description: https://datasheet.octopart.com:443/CR2512-J--000ELF-Bourns-datasheet-159777434.pdf?src-supplier=IHS; ComponentLink3URL: https://datasheet.octopart.com:443/CR2512-J--000ELF-Bourns-datasheet-38188400.pdf?src-supplier=element14+APAC; ComponentLink3Description: https://datasheet.octopart.com:443/CR2512-J--000ELF-Bourns-datasheet-38188400.pdf?src-supplier=element14+APAC; ComponentLink4URL: https://datasheet.octopart.com:443/CR2512-J--000ELF-Bourns-datasheet-68301993.pdf?src-supplier=Master+Electronics; ComponentLink4Description: https://datasheet.octopart.com:443/CR2512-J--000ELF-Bourns-datasheet-68301993.pdf?src-supplier=Master+Electronics; ComponentLink5URL: https://datasheet.octopart.com:443/CR2512-J--000ELF-Bourns-datasheet-177039333.pdf?src-supplier=Burklin+Elektronik; ComponentLink5Description: https://datasheet.octopart.com:443/CR2512-J--000ELF-Bourns-datasheet-177039333.pdf?src-supplier=Burklin+Elektronik; ComponentLink6URL: http://sigma.octopart.com:80/conflict_mineral_statement/Bourns-company-36.pdf?src-supplier=Compliance+Statements; ComponentLink6Description: http://sigma.octopart.com:80/conflict_mineral_statement/Bourns-company-36.pdf?src-supplier=Compliance+Statements; Supplier Part Number 1: CR2512-J/-000ELFCT-ND; Resistance: 0Ω
R4 = CRCW060310R0FKEAHP: 10Ω Res Thick Film 0603 10 Ohm 1% 1/3W ±100ppm/°C Molded SMD SMD Paper T/R; Manufacturer: Vishay; Voltage Rating: 75V; Max Power Dissipation: 250mW; Supplier 1: DigiKey; Manufacturer Part Number: CRCW060310R0FKEAHP; RoHS: Compliant; Category: Chip SMD Resistors; Stock 1: 818624; Pricing 1: 1=0.15, 10=0.072, 25=0.0564, 50=0.0472, 100=0.04, 250=0.03284, 500=0.02872, 1000=0.02546 (USD); Case Code (Metric): 1608; China RoHS: Non-Compliant; Composition: Thick Film; Contact Plating: Tin; Depth: 850µm; Features: Automotive AEC-Q200; Height: 450µm; Lead Free: Lead Free; Length: 1.6mm; Lifecycle Status: Production; Max Operating Temperature: 155°C; Military Standard: Not; Min Operating Temperature: -55°C; Mount: Surface Mount; Number of Pins: 2; Number of Terminals: 2; Number of Terminations: 2; Packaging: Cut Tape; Radiation Hardening: No; Ratings: AEC-Q200; REACH SVHC: Yes; Schedule B: 8533210045, 8533210045|8533210045|8533210045|8533210045|8533210045; Temperature Coefficient: 100ppm/°C; Termination: Solder; Voltage Rating (DC): 75V; Weight: 2.012816mg; Width: 850µm; Working Voltage: 75V; ComponentLink1URL: https://datasheet.octopart.com:443/CRCW060310R0FKEAHP-Vishay-datasheet-13148866.pdf?src-supplier=Future+Electronics; ComponentLink1Description: https://datasheet.octopart.com:443/CRCW060310R0FKEAHP-Vishay-datasheet-13148866.pdf?src-supplier=Future+Electronics; ComponentLink2URL: https://datasheet.octopart.com:443/CRCW060310R0FKEAHP-Vishay-datasheet-13131392.pdf?src-supplier=Future+Electronics; ComponentLink2Description: https://datasheet.octopart.com:443/CRCW060310R0FKEAHP-Vishay-datasheet-13131392.pdf?src-supplier=Future+Electronics; ComponentLink3URL: https://datasheet.octopart.com:443/CRCW060310R0FKEAHP-Vishay-datasheet-12593106.pdf?src-supplier=Future+Electronics; ComponentLink3Description: https://datasheet.octopart.com:443/CRCW060310R0FKEAHP-Vishay-datasheet-12593106.pdf?src-supplier=Future+Electronics; ComponentLink4URL: https://datasheet.octopart.com:443/CRCW060310R0FKEAHP-Vishay-datasheet-12544674.pdf?src-supplier=Future+Electronics; ComponentLink4Description: https://datasheet.octopart.com:443/CRCW060310R0FKEAHP-Vishay-datasheet-12544674.pdf?src-supplier=Future+Electronics; ComponentLink5URL: https://datasheet.octopart.com:443/CRCW060310R0FKEAHP-Vishay-datasheet-12531795.pdf?src-supplier=Future+Electronics; ComponentLink5Description: https://datasheet.octopart.com:443/CRCW060310R0FKEAHP-Vishay-datasheet-12531795.pdf?src-supplier=Future+Electronics; ComponentLink6URL: https://datasheet.octopart.com:443/CRCW060310R0FKEAHP-Vishay-datasheet-12509906.pdf?src-supplier=Future+Electronics; ComponentLink6Description: https://datasheet.octopart.com:443/CRCW060310R0FKEAHP-Vishay-datasheet-12509906.pdf?src-supplier=Future+Electronics; ComponentLink7URL: https://datasheet.octopart.com:443/CRCW060310R0FKEAHP-Vishay-datasheet-10669844.pdf?src-supplier=Future+Electronics; ComponentLink7Description: https://datasheet.octopart.com:443/CRCW060310R0FKEAHP-Vishay-datasheet-10669844.pdf?src-supplier=Future+Electronics; ComponentLink8URL: https://datasheet.octopart.com:443/CRCW060310R0FKEAHP-Vishay-datasheet-8703221.pdf?src-supplier=Future+Electronics; ComponentLink8Description: https://datasheet.octopart.com:443/CRCW060310R0FKEAHP-Vishay-datasheet-8703221.pdf?src-supplier=Future+Electronics; ComponentLink9URL: https://datasheet.octopart.com:443/CRCW060310R0FKEAHP-Vishay-datasheet-62316122.pdf?src-supplier=Future+Electronics; ComponentLink9Description: https://datasheet.octopart.com:443/CRCW060310R0FKEAHP-Vishay-datasheet-62316122.pdf?src-supplier=Future+Electronics; ComponentLink10URL: https://datasheet.octopart.com:443/CRCW060310R0FKEAHP-Vishay-datasheet-12518686.pdf?src-supplier=_legacy+Avnet; ComponentLink10Description: https://datasheet.octopart.com:443/CRCW060310R0FKEAHP-Vishay-datasheet-12518686.pdf?src-supplier=_legacy+Avnet; ComponentLink11URL: https://datasheet.octopart.com:443/CRCW060310R0FKEAHP-Vishay-datasheet-87136057.pdf?src-supplier=element14+APAC; ComponentLink11Description: https://datasheet.octopart.com:443/CRCW060310R0FKEAHP-Vishay-datasheet-87136057.pdf?src-supplier=element14+APAC; ComponentLink12URL: https://datasheet.octopart.com:443/CRCW060310R0FKEAHP-Vishay-datasheet-78776210.pdf?src-supplier=element14+APAC; ComponentLink12Description: https://datasheet.octopart.com:443/CRCW060310R0FKEAHP-Vishay-datasheet-78776210.pdf?src-supplier=element14+APAC; ComponentLink13URL: https://datasheet.octopart.com:443/CRCW060310R0FKEAHP-Vishay-datasheet-62317933.pdf?src-supplier=element14+APAC; ComponentLink13Description: https://datasheet.octopart.com:443/CRCW060310R0FKEAHP-Vishay-datasheet-62317933.pdf?src-supplier=element14+APAC; ComponentLink14URL: https://datasheet.octopart.com:443/CRCW060310R0FKEAHP-Vishay-datasheet-66581887.pdf?src-supplier=element14+APAC; ComponentLink14Description: https://datasheet.octopart.com:443/CRCW060310R0FKEAHP-Vishay-datasheet-66581887.pdf?src-supplier=element14+APAC; ComponentLink15URL: https://datasheet.octopart.com:443/CRCW060310R0FKEAHP-Vishay-datasheet-37143532.pdf?src-supplier=Newark; ComponentLink15Description: https://datasheet.octopart.com:443/CRCW060310R0FKEAHP-Vishay-datasheet-37143532.pdf?src-supplier=Newark; ComponentLink16URL: https://datasheet.octopart.com:443/CRCW060310R0FKEAHP-Vishay-datasheet-8359436.pdf?src-supplier=Newark; ComponentLink16Description: https://datasheet.octopart.com:443/CRCW060310R0FKEAHP-Vishay-datasheet-8359436.pdf?src-supplier=Newark; ComponentLink17URL: https://datasheet.octopart.com:443/CRCW060310R0FKEAHP-Vishay-datasheet-112276998.pdf?src-supplier=Newark; ComponentLink17Description: https://datasheet.octopart.com:443/CRCW060310R0FKEAHP-Vishay-datasheet-112276998.pdf?src-supplier=Newark; ComponentLink18URL: https://datasheet.octopart.com:443/CRCW060310R0FKEAHP-Vishay-datasheet-192322425.pdf?src-supplier=HQonline; ComponentLink18Description: https://datasheet.octopart.com:443/CRCW060310R0FKEAHP-Vishay-datasheet-192322425.pdf?src-supplier=HQonline; ComponentLink19URL: https://datasheet.octopart.com/CRCW060310R0FKEAHP-Vishay-datasheet-83567917.pdf; ComponentLink19Description: https://datasheet.octopart.com/CRCW060310R0FKEAHP-Vishay-datasheet-83567917.pdf; ComponentLink20URL: https://datasheet.octopart.com/D-CRCW-e3-Standard-Thick-Film-Chip-Resistors-Vishay-datasheet-family-64.pdf; ComponentLink20Description: https://datasheet.octopart.com/D-CRCW-e3-Standard-Thick-Film-Chip-Resistors-Vishay-datasheet-family-64.pdf; ComponentLink21URL: https://datasheet.octopart.com:443/CRCW060310R0FKEAHP-Vishay-Dale-datasheet-47688881.pdf?src-supplier=RS+(Formerly+Allied+Electronics); ComponentLink21Description: https://datasheet.octopart.com:443/CRCW060310R0FKEAHP-Vishay-Dale-datasheet-47688881.pdf?src-supplier=RS+(Formerly+Allied+Electronics); ComponentLink22URL: https://datasheet.octopart.com:443/CRCW060310R0FKEAHP-Vishay-datasheet-17834126.pdf?src-supplier=TME; ComponentLink22Description: https://datasheet.octopart.com:443/CRCW060310R0FKEAHP-Vishay-datasheet-17834126.pdf?src-supplier=TME; ComponentLink23URL: http://sigma.octopart.com:80/rohs_certificate/D-CRCW-e3-Standard-Thick-Film-Chip-Resistors-Vishay-family-102.pdf?src-supplier=Compliance+Statements; ComponentLink23Description: http://sigma.octopart.com:80/rohs_certificate/D-CRCW-e3-Standard-Thick-Film-Chip-Resistors-Vishay-family-102.pdf?src-supplier=Compliance+Statements; Case/Package: 0603; Supplier Part Number 1: 541-10.0SCT-ND; Resistance: 10Ω
R5 = CRCW040210K0FKEDHP: 10kΩ Res Thick Film 0402 10K Ohm 1% 0.2W ±100ppm/°C Molded SMD SMD Paper T/R; Manufacturer: Vishay; Manufacturer Package Identifier: CRCW0402-HPe3; Voltage Rating: 50V; Supplier 1: DigiKey; Manufacturer Part Number: CRCW040210K0FKEDHP; RoHS: Compliant; Category: Chip SMD Resistors; Stock 1: 168325; Pricing 1: 1=0.12, 10=0.057, 25=0.0436, 50=0.0362, 100=0.0303, 250=0.02452, 500=0.02122, 1000=0.0186, 5000=0.01445 (USD); Case Code (Imperial): 0402; Case Code (Metric): 1005; China RoHS: Non-Compliant; Composition: Thick Film; Contact Plating: Tin; Country of Origin: Israel, Mainland China; Depth: 500µm; Export Control Classification Number (ECCN) Code: EAR99; Height: 300µm; Harmonized Tariff Schedule (HTS) Code: 8533.21.00.30; Introduction Date: 2008-07-29; Lead Free: Lead Free; Length: 1mm; Lifecycle Status: Production; Max Operating Temperature: 155°C; Military Standard: Not; Min Operating Temperature: -55°C; Mount: Surface Mount; Number of Pins: 2; Number of Terminals: 2; Packaging: Cut Tape; Radiation Hardening: No; Ratings: AEC-Q200; REACH SVHC: Yes; Schedule B: 8533210045; Temperature Coefficient: 100ppm/°C; Termination: SMD/SMT; Voltage Rating (DC): 50V; Weight: 652.039032µg; Width: 500µm; Working Voltage: 50V; ComponentLink1URL: https://datasheet.octopart.com/CRCW040210K0FKEDHP-Vishay-datasheet-83567917.pdf; ComponentLink1Description: https://datasheet.octopart.com/CRCW040210K0FKEDHP-Vishay-datasheet-83567917.pdf; ComponentLink2URL: https://datasheet.octopart.com:443/CRCW040210K0FKEDHP-Vishay-datasheet-13148866.pdf?src-supplier=Newark; ComponentLink2Description: https://datasheet.octopart.com:443/CRCW040210K0FKEDHP-Vishay-datasheet-13148866.pdf?src-supplier=Newark; ComponentLink3URL: https://datasheet.octopart.com:443/CRCW040210K0FKEDHP-Vishay-datasheet-13131392.pdf?src-supplier=Newark; ComponentLink3Description: https://datasheet.octopart.com:443/CRCW040210K0FKEDHP-Vishay-datasheet-13131392.pdf?src-supplier=Newark; ComponentLink4URL: https://datasheet.octopart.com:443/CRCW040210K0FKEDHP-Vishay-datasheet-12593106.pdf?src-supplier=Newark; ComponentLink4Description: https://datasheet.octopart.com:443/CRCW040210K0FKEDHP-Vishay-datasheet-12593106.pdf?src-supplier=Newark; ComponentLink5URL: https://datasheet.octopart.com:443/CRCW040210K0FKEDHP-Vishay-datasheet-12544674.pdf?src-supplier=Newark; ComponentLink5Description: https://datasheet.octopart.com:443/CRCW040210K0FKEDHP-Vishay-datasheet-12544674.pdf?src-supplier=Newark; ComponentLink6URL: https://datasheet.octopart.com:443/CRCW040210K0FKEDHP-Vishay-datasheet-12531795.pdf?src-supplier=Newark; ComponentLink6Description: https://datasheet.octopart.com:443/CRCW040210K0FKEDHP-Vishay-datasheet-12531795.pdf?src-supplier=Newark; ComponentLink7URL: https://datasheet.octopart.com:443/CRCW040210K0FKEDHP-Vishay-datasheet-12518686.pdf?src-supplier=Newark; ComponentLink7Description: https://datasheet.octopart.com:443/CRCW040210K0FKEDHP-Vishay-datasheet-12518686.pdf?src-supplier=Newark; ComponentLink8URL: https://datasheet.octopart.com:443/CRCW040210K0FKEDHP-Vishay-datasheet-12509906.pdf?src-supplier=Newark; ComponentLink8Description: https://datasheet.octopart.com:443/CRCW040210K0FKEDHP-Vishay-datasheet-12509906.pdf?src-supplier=Newark; ComponentLink9URL: https://datasheet.octopart.com:443/CRCW040210K0FKEDHP-Vishay-datasheet-10669844.pdf?src-supplier=Newark; ComponentLink9Description: https://datasheet.octopart.com:443/CRCW040210K0FKEDHP-Vishay-datasheet-10669844.pdf?src-supplier=Newark; ComponentLink10URL: https://datasheet.octopart.com:443/CRCW040210K0FKEDHP-Vishay-datasheet-8703221.pdf?src-supplier=Newark; ComponentLink10Description: https://datasheet.octopart.com:443/CRCW040210K0FKEDHP-Vishay-datasheet-8703221.pdf?src-supplier=Newark; ComponentLink11URL: https://datasheet.octopart.com:443/CRCW040210K0FKEDHP.-Vishay-datasheet-78776210.pdf?src-supplier=Newark; ComponentLink11Description: https://datasheet.octopart.com:443/CRCW040210K0FKEDHP.-Vishay-datasheet-78776210.pdf?src-supplier=Newark; ComponentLink12URL: https://datasheet.octopart.com:443/CRCW040210K0FKEDHP-Vishay-datasheet-21268118.pdf?src-supplier=Newark; ComponentLink12Description: https://datasheet.octopart.com:443/CRCW040210K0FKEDHP-Vishay-datasheet-21268118.pdf?src-supplier=Newark; ComponentLink13URL: https://datasheet.octopart.com:443/CRCW040210K0FKEDHP-Vishay-datasheet-21226360.pdf?src-supplier=Newark; ComponentLink13Description: https://datasheet.octopart.com:443/CRCW040210K0FKEDHP-Vishay-datasheet-21226360.pdf?src-supplier=Newark; ComponentLink14URL: https://datasheet.octopart.com:443/CRCW040210K0FKEDHP-Vishay-Draloric-datasheet-8359436.pdf?src-supplier=Newark; ComponentLink14Description: https://datasheet.octopart.com:443/CRCW040210K0FKEDHP-Vishay-Draloric-datasheet-8359436.pdf?src-supplier=Newark; ComponentLink15URL: https://datasheet.octopart.com:443/CRCW040210K0FKEDHP-Vishay-datasheet-87136057.pdf?src-supplier=Farnell; ComponentLink15Description: https://datasheet.octopart.com:443/CRCW040210K0FKEDHP-Vishay-datasheet-87136057.pdf?src-supplier=Farnell; ComponentLink16URL: https://datasheet.octopart.com:443/CRCW040210K0FKEDHP-Vishay-datasheet-37143532.pdf?src-supplier=Farnell; ComponentLink16Description: https://datasheet.octopart.com:443/CRCW040210K0FKEDHP-Vishay-datasheet-37143532.pdf?src-supplier=Farnell; ComponentLink17URL: https://datasheet.octopart.com:443/CRCW040210K0FKEDHP-Vishay-datasheet-41195455.pdf?src-supplier=Farnell; ComponentLink17Description: https://datasheet.octopart.com:443/CRCW040210K0FKEDHP-Vishay-datasheet-41195455.pdf?src-supplier=Farnell; ComponentLink18URL: https://datasheet.octopart.com:443/CRCW040210K0FKEDHP.-Vishay-datasheet-66581887.pdf?src-supplier=Farnell; ComponentLink18Description: https://datasheet.octopart.com:443/CRCW040210K0FKEDHP.-Vishay-datasheet-66581887.pdf?src-supplier=Farnell; ComponentLink19URL: https://datasheet.octopart.com:443/CRCW040210K0FKEDHP-Vishay-datasheet-62317933.pdf?src-supplier=element14+APAC; ComponentLink19Description: https://datasheet.octopart.com:443/CRCW040210K0FKEDHP-Vishay-datasheet-62317933.pdf?src-supplier=element14+APAC; ComponentLink20URL: https://datasheet.octopart.com:443/CRCW040210K0FKEDHP-Vishay-Dale-datasheet-41169523.pdf?src-supplier=element14+APAC; ComponentLink20Description: https://datasheet.octopart.com:443/CRCW040210K0FKEDHP-Vishay-Dale-datasheet-41169523.pdf?src-supplier=element14+APAC; ComponentLink21URL: https://datasheet.octopart.com:443/CRCW040210K0FKEDHP-Vishay-datasheet-192322387.pdf?src-supplier=HQonline; ComponentLink21Description: https://datasheet.octopart.com:443/CRCW040210K0FKEDHP-Vishay-datasheet-192322387.pdf?src-supplier=HQonline; ComponentLink22URL: https://datasheet.octopart.com:443/CRCW040210K0FKEDHP-Vishay-datasheet-62316122.pdf?src-supplier=Future+Electronics; ComponentLink22Description: https://datasheet.octopart.com:443/CRCW040210K0FKEDHP-Vishay-datasheet-62316122.pdf?src-supplier=Future+Electronics; ComponentLink23URL: https://datasheet.octopart.com:443/CRCW040210K0FKEDHP-Vishay-Dale-datasheet-47688881.pdf?src-supplier=RS+(Formerly+Allied+Electronics); ComponentLink23Description: https://datasheet.octopart.com:443/CRCW040210K0FKEDHP-Vishay-Dale-datasheet-47688881.pdf?src-supplier=RS+(Formerly+Allied+Electronics); ComponentLink24URL: https://datasheet.octopart.com:443/CRCW040210K0FKEDHP-Vishay-datasheet-11548710.pdf?src-supplier=Arrow+Electronics; ComponentLink24Description: https://datasheet.octopart.com:443/CRCW040210K0FKEDHP-Vishay-datasheet-11548710.pdf?src-supplier=Arrow+Electronics; ComponentLink25URL: http://sigma.octopart.com:80/rohs_statement/Vishay-company-15.pdf?src-supplier=Compliance+Statements; ComponentLink25Description: http://sigma.octopart.com:80/rohs_statement/Vishay-company-15.pdf?src-supplier=Compliance+Statements; Supplier Part Number 1: 541-10.0KYDKR-ND